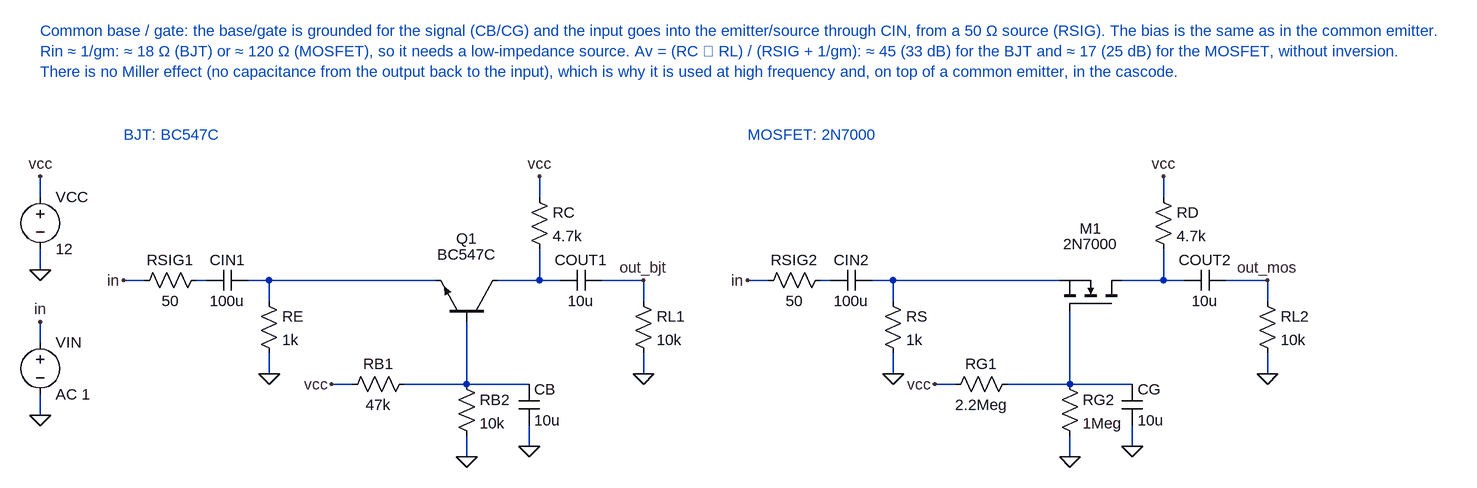
[diagram p0: schematic cb.asc]
cb.asc, the LTspice schematic file:
Version 4
SHEET 1 1600 800
WIRE -448 0 -448 32
WIRE -448 112 -448 144
WIRE -448 224 -448 256
WIRE -448 336 -448 368
WIRE -320 160 -288 160
WIRE -208 160 -192 160
WIRE -128 160 -96 160
WIRE -96 160 160 160
WIRE -96 160 -96 192
WIRE -96 272 -96 304
WIRE 256 160 320 160
WIRE 320 0 320 32
WIRE 320 112 320 160
WIRE 320 160 352 160
WIRE 416 160 480 160
WIRE 480 160 480 192
WIRE 480 272 480 304
WIRE 208 224 208 320
WIRE 208 400 208 432
WIRE 208 320 304 320
WIRE 304 384 304 416
WIRE 112 320 208 320
WIRE 0 320 32 320
WIRE 640 160 672 160
WIRE 752 160 768 160
WIRE 832 160 864 160
WIRE 864 160 1120 160
WIRE 864 160 864 192
WIRE 864 272 864 304
WIRE 1216 160 1280 160
WIRE 1280 0 1280 32
WIRE 1280 112 1280 160
WIRE 1280 160 1312 160
WIRE 1376 160 1440 160
WIRE 1440 160 1440 192
WIRE 1440 272 1440 304
WIRE 1136 208 1136 320
WIRE 1136 400 1136 432
WIRE 1136 320 1232 320
WIRE 1232 384 1232 416
WIRE 1040 320 1136 320
WIRE 928 320 960 320
FLAG -448 0 vcc
FLAG -448 144 0
FLAG -448 224 in
FLAG -448 368 0
FLAG -320 160 in
FLAG -96 304 0
FLAG 320 0 vcc
FLAG 480 160 out_bjt
FLAG 480 304 0
FLAG 208 432 0
FLAG 304 416 0
FLAG 0 320 vcc
FLAG 640 160 in
FLAG 864 304 0
FLAG 1280 0 vcc
FLAG 1440 160 out_mos
FLAG 1440 304 0
FLAG 1136 432 0
FLAG 1232 416 0
FLAG 928 320 vcc
SYMBOL voltage -448 16 R0
SYMATTR InstName VCC
SYMATTR Value 12
SYMBOL voltage -448 240 R0
SYMATTR InstName VIN
SYMATTR Value AC 1
SYMBOL npn 256 224 M270
WINDOW 0 128 48 VCenter 2
WINDOW 3 104 48 VCenter 2
SYMATTR InstName Q1
SYMATTR Value BC547C
SYMBOL res -192 144 R90
WINDOW 0 0 56 VBottom 2
WINDOW 3 32 56 VTop 2
SYMATTR InstName RSIG1
SYMATTR Value 50
SYMBOL cap -128 144 R90
WINDOW 0 0 32 VBottom 2
WINDOW 3 32 32 VTop 2
SYMATTR InstName CIN1
SYMATTR Value 100u
SYMBOL res -112 176 R0
SYMATTR InstName RE
SYMATTR Value 1k
SYMBOL res 304 16 R0
SYMATTR InstName RC
SYMATTR Value 4.7k
SYMBOL cap 416 144 R90
WINDOW 0 0 32 VBottom 2
WINDOW 3 32 32 VTop 2
SYMATTR InstName COUT1
SYMATTR Value 10u
SYMBOL res 464 176 R0
SYMATTR InstName RL1
SYMATTR Value 10k
SYMBOL res 192 304 R0
SYMATTR InstName RB2
SYMATTR Value 10k
SYMBOL cap 288 320 R0
SYMATTR InstName CB
SYMATTR Value 10u
SYMBOL res 128 304 R90
WINDOW 0 0 56 VBottom 2
WINDOW 3 32 56 VTop 2
SYMATTR InstName RB1
SYMATTR Value 47k
SYMBOL nmos 1216 208 M270
WINDOW 0 128 48 VCenter 2
WINDOW 3 104 48 VCenter 2
SYMATTR InstName M1
SYMATTR Value 2N7000
SYMBOL res 768 144 R90
WINDOW 0 0 56 VBottom 2
WINDOW 3 32 56 VTop 2
SYMATTR InstName RSIG2
SYMATTR Value 50
SYMBOL cap 832 144 R90
WINDOW 0 0 32 VBottom 2
WINDOW 3 32 32 VTop 2
SYMATTR InstName CIN2
SYMATTR Value 100u
SYMBOL res 848 176 R0
SYMATTR InstName RS
SYMATTR Value 1k
SYMBOL res 1264 16 R0
SYMATTR InstName RD
SYMATTR Value 4.7k
SYMBOL cap 1376 144 R90
WINDOW 0 0 32 VBottom 2
WINDOW 3 32 32 VTop 2
SYMATTR InstName COUT2
SYMATTR Value 10u
SYMBOL res 1424 176 R0
SYMATTR InstName RL2
SYMATTR Value 10k
SYMBOL res 1120 304 R0
SYMATTR InstName RG2
SYMATTR Value 1Meg
SYMBOL cap 1216 320 R0
SYMATTR InstName CG
SYMATTR Value 10u
SYMBOL res 1056 304 R90
WINDOW 0 0 56 VBottom 2
WINDOW 3 32 56 VTop 2
SYMATTR InstName RG1
SYMATTR Value 2.2Meg
TEXT -448 -224 Left 2 ;Common base / gate: the base/gate is grounded for the signal (CB/CG) and the input goes into the emitter/source through CIN, from a 50 Ω source (RSIG). The bias is the same as in the common emitter.\nRin ≈ 1/gm: ≈ 18 Ω (BJT) or ≈ 120 Ω (MOSFET), so it needs a low-impedance source. Av = (RC ∥ RL) / (RSIG + 1/gm): ≈ 45 (33 dB) for the BJT and ≈ 17 (25 dB) for the MOSFET, without inversion.\nThere is no Miller effect (no capacitance from the output back to the input), which is why it is used at high frequency and, on top of a common emitter, in the cascode.
TEXT -320 -64 Left 2 ;BJT: BC547C
TEXT 640 -64 Left 2 ;MOSFET: 2N7000

The netlist it stands for:
* cb.asc
VCC vcc 0 12
VIN in 0 AC 1
Q1 N003 N004 N002 0 BC547C
RSIG1 N001 in 50
CIN1 N002 N001 100u
RE N002 0 1k
RC vcc N003 4.7k
COUT1 out_bjt N003 10u
RL1 out_bjt 0 10k
RB2 N004 0 10k
CB N004 0 10u
RB1 N004 vcc 47k
M1 N007 N008 N006 N006 2N7000
RSIG2 N005 in 50
CIN2 N006 N005 100u
RS N006 0 1k
RD vcc N007 4.7k
COUT2 out_mos N007 10u
RL2 out_mos 0 10k
RG2 N008 0 1Meg
CG N008 0 10u
RG1 N008 vcc 2.2Meg
.model NPN NPN
.model PNP PNP
.lib standard.bjt
.model NMOS NMOS
.model PMOS PMOS
.lib standard.mos
* Common base / gate: the base/gate is grounded for the signal (CB/CG) and the input goes into the emitter/source through CIN, from a 50 Ω source (RSIG). The bias is the same as in the common emitter.
* Rin ≈ 1/gm: ≈ 18 Ω (BJT) or ≈ 120 Ω (MOSFET), so it needs a low-impedance source. Av = (RC ∥ RL) / (RSIG + 1/gm): ≈ 45 (33 dB) for the BJT and ≈ 17 (25 dB) for the MOSFET, without inversion.
* There is no Miller effect (no capacitance from the output back to the input), which is why it is used at high frequency and, on top of a common emitter, in the cascode.
* BJT: BC547C
* MOSFET: 2N7000
.backanno
.end